# Altium schematic sheet Spec.SchDoc
size A; SheetNumber: 1; SheetTotal: 7
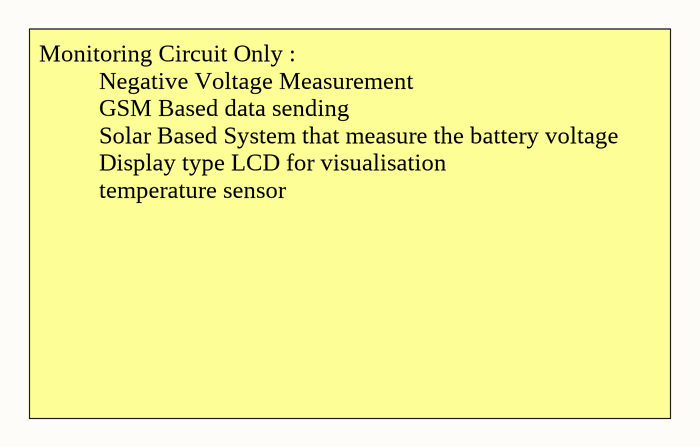
[diagram p0: Spec.SchDoc]

## Notes on the sheet
- Monitoring Circuit Only :
  Negative Voltage Measurement
  GSM Based data sending
  Solar Based System that measure the battery voltage
  Display type LCD for visualisation
  temperature sensor